# EasyEDA Pro project satelitesbol.eprj, schematic EPS
Board Name: PCB4; Create Date: 2025-08-20; Page Name: Main Board; Project Name: satelitesbol; Schematic Name: EPS; Update Date: 2025-08-31; Company: EasyEDA.com; Page Size: A4; Version: V1.0
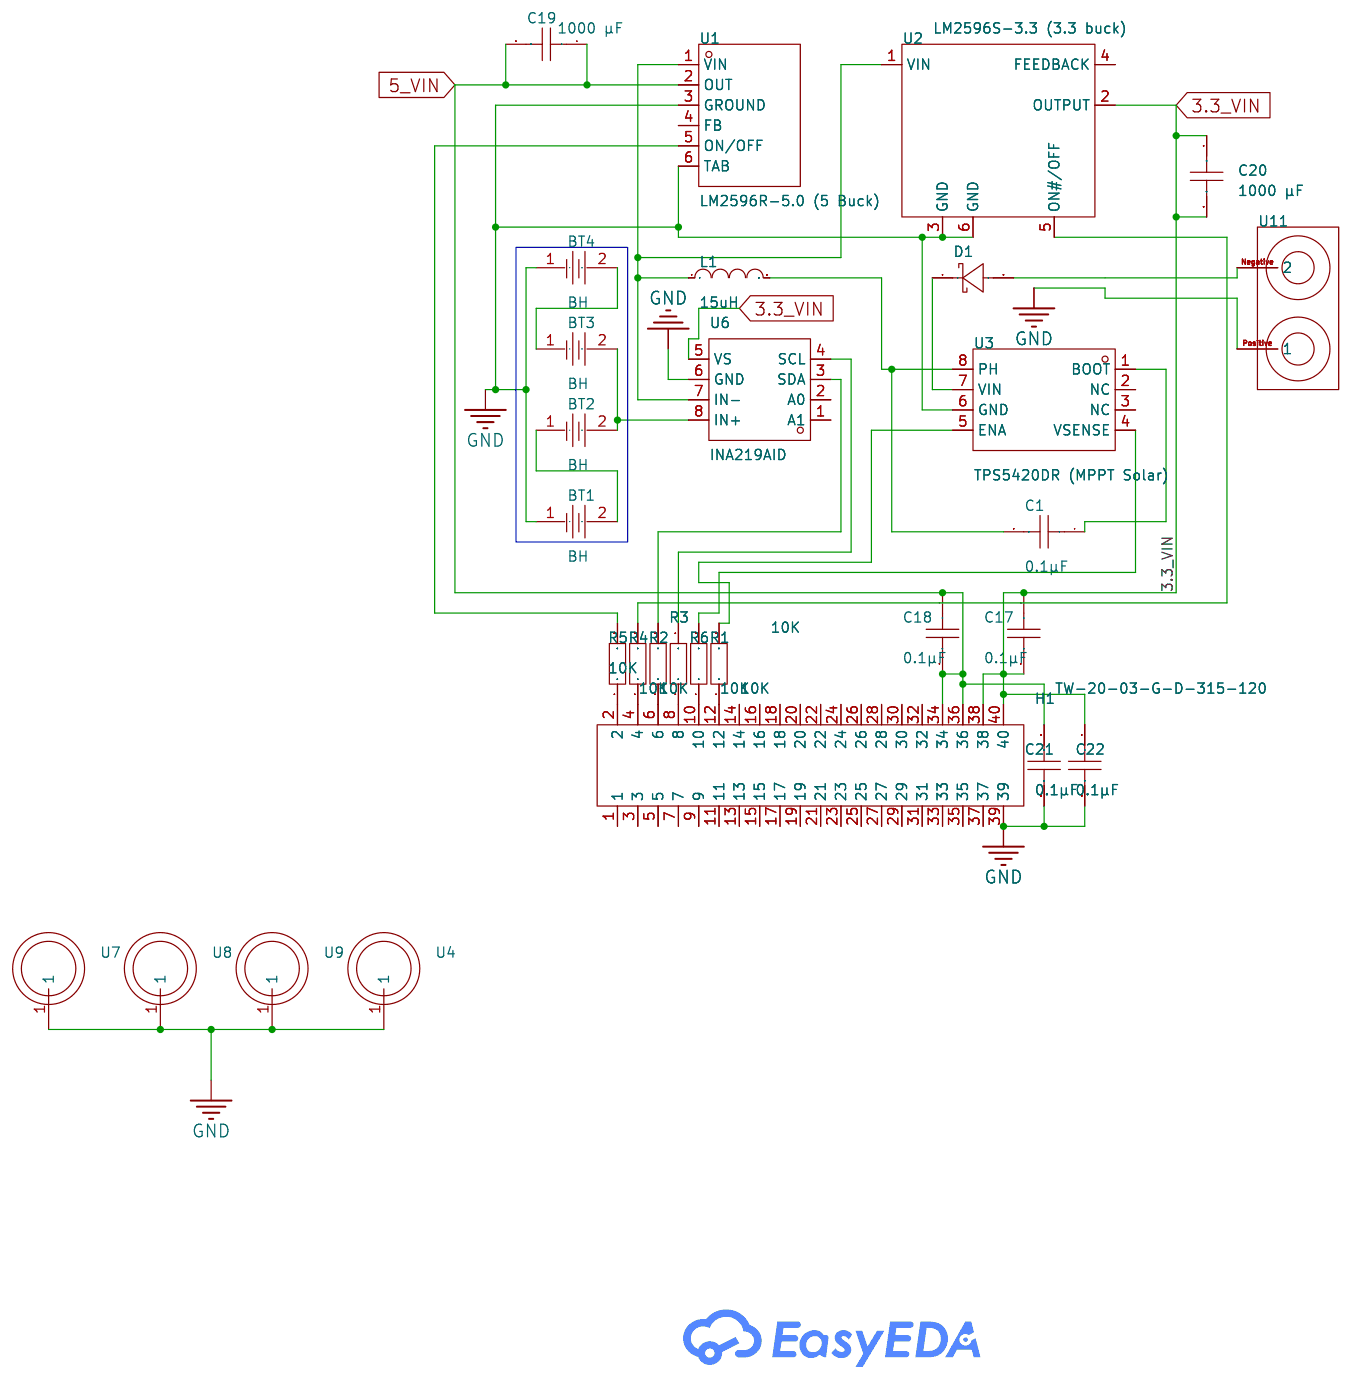
[diagram p1: schematic sheet]

## Parts
BT1  BH  [BAT-TH_BH-18650-3]
BT2  BH  [BAT-TH_BH-18650-3]
BT3  BH  [BAT-TH_BH-18650-3]
BT4  BH  [BAT-TH_BH-18650-3]
C1  0.1µF  [L0805]
C17  0.1 µF  [L0805]
C18  0.1 µF  [L0805]
C19  1000 µF  [L0805]
C20  1000 µF  [L0805]
C21  0.1µF  [L0805]
C22  0.1µF  [L0805]
D1  SS2P2L-M3/84A  [DO-220AA_L3.4-W2.0-LS3.9-RD]
H1  TW-20-03-G-D-315-120  [HDR-TH_40P-P2.00-V-M-R2-C20-S2.00-1]
L1  15uH  [L0805]
R1  10K  [R0805]
R2  10K  [R0805]
R3  10K  [R0805]
R4  10K  [R0805]
R5  10K  [R0805]
R6  10K  [R0805]
U1  LM2596R-5.0 (5 Buck)  [TO-263-5_L10.2-W8.6-P1.70-LS14.4-TL]
U2  LM2596S-3.3 (3.3 buck)  [TO-263-5_L10.2-W8.9-P1.70-LS15.0-BR]
U3  TPS5420DR (MPPT Solar)  [SOIC-8_L4.9-W3.9-P1.27-LS6.0-BL]
U4  -  [M_H]
U6  INA219AID  [SOIC-8_L4.9-W3.9-P1.27-LS6.0-BL]
U7  -  [M_H]
U8  -  [M_H]
U9  -  [M_H]
U11  -  [MG]

## Library data of the parts
BT1-BT4 = BH-18650-3: Supplier Part: C49118397; Manufacturer: HanElectricity(瀚源); Supplier Footprint: 插件; JLCPCB Part Class: Extended Part; Datasheet: https://atta.szlcsc.com/upload/public/pdf/source/20250610/6AAB63E9CF14D6AC60BE25C3426F7AE9.pdf; Supplier: LCSC
C1 C17-C22 = CAP_0201: Supplier Footprint: 0201
D1 = SS2P2L-M3/84A: LCSC Part Name: 电压:20V 电流:2A; Supplier Part: C222481; Manufacturer: VISHAY(威世); Supplier Footprint: SMP(DO-220AA); JLCPCB Part Class: Extended Part; Datasheet: https://item.szlcsc.com/datasheet/SS2P2L-M3%252F84A/222776.html; Supplier: LCSC; Diode Configuration: 1 Independent; Voltage - Forward(Vf@If): 500mV@2A; Voltage - DC Reverse(Vr): 20V; Current - Rectified: 2A; Reverse Leakage Current (Ir): 200uA@20V; Operating Junction Temperature Range: -55℃~+150℃; Non-Repetitive Peak Forward Surge Current: 50A
H1 = TW-20-03-G-D-315-120: LCSC Part Name: 间距:2mm 直插; Supplier Part: C7371248; Manufacturer: SAMTEC; Supplier Footprint: 插件,P=2mm; JLCPCB Part Class: Extended Part; Datasheet: https://item.szlcsc.com/datasheet/TW-20-03-G-D-315-120/8342295.html; Supplier: LCSC; Pitch: 2mm; Row Spacing: 2mm; Mounting Type: Through Hole; Number of Rows: 2; Number of Pins: 40P; Contact Plating: Gold; Color: Black
L1 = L_0402: Supplier Footprint: L0402
R1-R6 = Res_0603
U1 = LM2596R-5.0: Supplier Part: C77782; Manufacturer: HTC; Supplier Footprint: TO-263-5; JLCPCB Part Class: Extended Part; Datasheet: https://atta.szlcsc.com/upload/public/pdf/source/20161217/1481939175231.pdf; Supplier: LCSC; Function: Step-down type; Output Current: 3A; Switching Frequency: 150kHz; Operating Temperature: -40℃~+125℃@(TJ); Number of Outputs: 1; Topology: Step-down; Switch tube (built-in/external): Built-in
U2 = LM2596S-3.3_C42421958: LCSC Part Name: LM2596S-3.3; Supplier Part: C42421958; Manufacturer: TDSEMIC(拓电半导体); Supplier Footprint: TO-263-5L; JLCPCB Part Class: Extended Part; Datasheet: https://item.szlcsc.com/datasheet/LM2596S-3.3/44440210.html; Supplier: LCSC; Function: Buck; Output Type: Fixed; Voltage - Supply: 40V; Output Voltage: 3.3V; Output Current: 3A; Frequency - Switching: 127kHz~173kHz; Operating Temperature: -40℃~+125℃; Synchronous Rectifier: No; Number of Outputs: 1; Topology: Buck; Quiescent Current: 5mA; Switch tube (built-in/external): Built-In
U3 = TPS5420DR: LCSC Part Name: 宽输入范围降压转换器; Supplier Part: C10111; Manufacturer: TI(德州仪器); Supplier Footprint: SOIC-8; JLCPCB Part Class: Extended Part; Datasheet: https://www.ti.com/cn/lit/gpn/tps5420; Supplier: LCSC; Function: Step-down type; Output Type: Adjustable; Input Voltage: 5.5V~36V; Output Voltage: 1.22V~31V; Output Current: 2A; Switching Frequency: 500kHz; Operating Temperature: -40℃~+125℃; Synchronous Rectification: Yes; Number of Outputs: 1; Topology: Step-down; Quiescent Current (Iq): 4.4mA; Switch tube (built-in/external): Built-in
U4 U7-U9 = M_H: mounting hole
U6 = INA219AID: LCSC Part Name: 具有I2C接口的零漂移双向电流/功率监测计; Supplier Part: C1574856; Manufacturer: TI(德州仪器); Supplier Footprint: SOIC-8; JLCPCB Part Class: Extended Part; Datasheet: https://www.ti.com/cn/lit/gpn/ina219; Supplier: LCSC; Number of Channels: 1; Vcm - Common Mode Voltage: 300mV~26V; Operating Temperature: -40℃~+125℃
U11 = MG: magnetorquer

## Nets
GND: BT1.1(-) BT4.1(-) C21.2 C22.2 H1.39 U1.3(GROUND) U1.6(TAB) U2.3(GND) U2.6(GND) U3.6(GND) U4.1 U6.6(GND) U7.1 U8.1 U9.1 U11.Positive(1)
3.3_VIN: C17.1 C17.2 C20.1 C20.2 C22.1 H1.38 H1.40 U2.2(OUTPUT) U6.5(VS)
5_VIN: C18.1 C18.2 C19.1 C19.2 C21.1 H1.34 H1.36 U1.2(OUT)
$1N1217: C1.1 U3.1(BOOT)
$1N1224: C1.2 L1.2 U3.8(PH)
$1N1231: R6.2 U3.4(VSENSE)
$1N1259: R1.2 U3.5(ENA)
$1N1874: BT3.1(-) BT4.2(+)
$1N1916: BT1.2(+) BT2.1(-)
$1N2139: L1.1 U1.1(VIN) U2.1(VIN) U6.7(IN-)
$1N2144: BT2.2(+) BT3.2(+) U6.8(IN+)
$1N3715: R2.2 U6.3(SDA)
$1N3778: R3.2 U6.4(SCL)
$1N3983: H1.6 R2.1
$1N3987: H1.8 R3.1
$1N4189: D1.1(K) U3.7(VIN)
$1N6188: H1.2 R5.1
$1N6202: H1.4 R4.1
$1N7172: H1.12 R1.1
$1N7175: H1.10 R6.1
$1N7279: R4.2 U2.5(ON#/OFF)
$1N7286: R5.2 U1.5(ON/OFF)
Net-(D1-2): D1.2(A) U11.Negative(2)

Not connected (* = marked no-connect by the designer): H1 1 3 5 7 9 11 13 14 15 16 17 18 19 20 21 22 23 24 25 26 27 28 29 30 31 32 33 35 37; U1 4(FB); U2 4(FEEDBACK); U3 2(NC) 3(NC); U6 1(A1) 2(A0)
